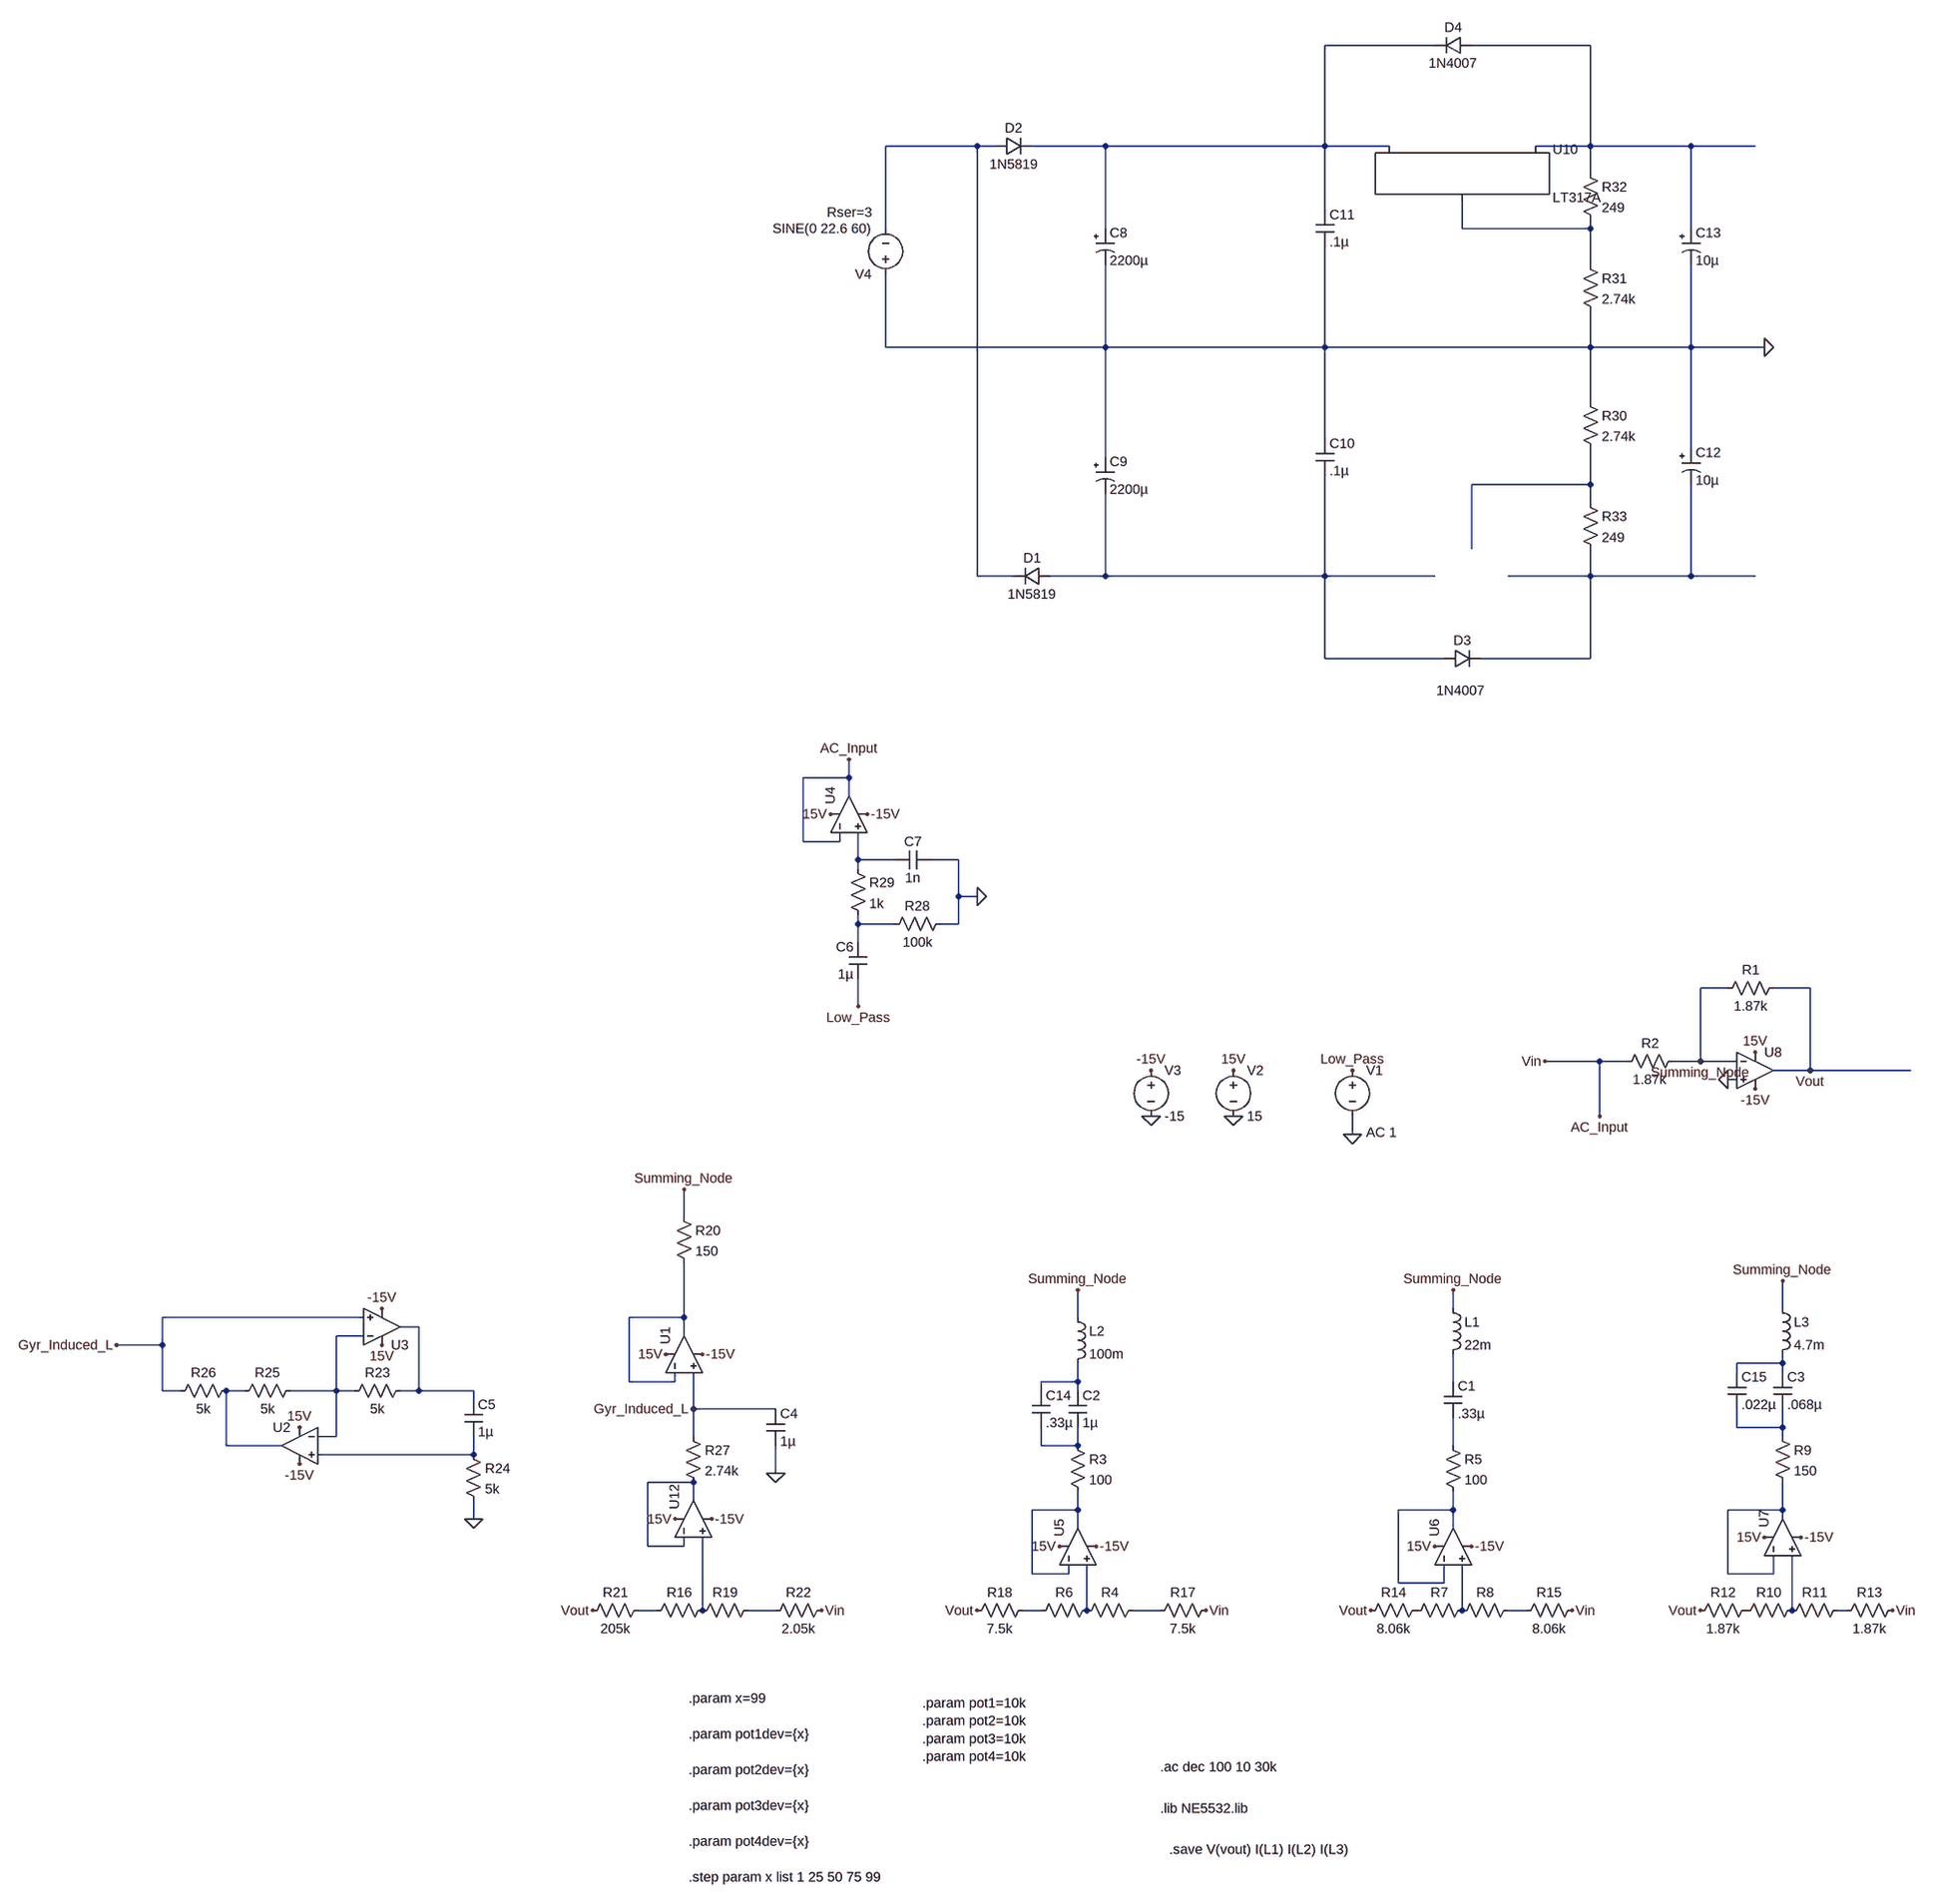
[diagram p0: schematic LCCircuit.asc]
LCCircuit.asc, the LTspice schematic file:
Version 4.1
SHEET 1 1272 1232
WIRE -1104 -2096 -1296 -2096
WIRE -832 -2096 -1040 -2096
WIRE -1904 -1920 -2064 -1920
WIRE -1872 -1920 -1904 -1920
WIRE -1680 -1920 -1808 -1920
WIRE -1296 -1920 -1296 -2096
WIRE -1296 -1920 -1680 -1920
WIRE -1184 -1920 -1296 -1920
WIRE -832 -1920 -832 -2096
WIRE -832 -1920 -928 -1920
WIRE -656 -1920 -832 -1920
WIRE -544 -1920 -656 -1920
WIRE -832 -1872 -832 -1920
WIRE -1296 -1808 -1296 -1920
WIRE -2064 -1776 -2064 -1920
WIRE -1680 -1776 -1680 -1920
WIRE -1056 -1776 -1056 -1824
WIRE -832 -1776 -832 -1792
WIRE -832 -1776 -1056 -1776
WIRE -656 -1776 -656 -1920
WIRE -832 -1712 -832 -1776
WIRE -2064 -1568 -2064 -1696
WIRE -1680 -1568 -1680 -1712
WIRE -1680 -1568 -2064 -1568
WIRE -1296 -1568 -1296 -1744
WIRE -1296 -1568 -1680 -1568
WIRE -832 -1568 -832 -1632
WIRE -832 -1568 -1296 -1568
WIRE -656 -1568 -656 -1712
WIRE -656 -1568 -832 -1568
WIRE -528 -1568 -656 -1568
WIRE -832 -1472 -832 -1568
WIRE -1296 -1408 -1296 -1568
WIRE -656 -1392 -656 -1568
WIRE -1680 -1376 -1680 -1568
WIRE -832 -1328 -832 -1392
WIRE -832 -1328 -1040 -1328
WIRE -832 -1296 -832 -1328
WIRE -1040 -1216 -1040 -1328
WIRE -1904 -1168 -1904 -1920
WIRE -1840 -1168 -1904 -1168
WIRE -1680 -1168 -1680 -1312
WIRE -1680 -1168 -1776 -1168
WIRE -1296 -1168 -1296 -1344
WIRE -1296 -1168 -1680 -1168
WIRE -1104 -1168 -1296 -1168
WIRE -832 -1168 -832 -1216
WIRE -832 -1168 -976 -1168
WIRE -656 -1168 -656 -1328
WIRE -656 -1168 -832 -1168
WIRE -544 -1168 -656 -1168
WIRE -1296 -1024 -1296 -1168
WIRE -1088 -1024 -1296 -1024
WIRE -832 -1024 -832 -1168
WIRE -832 -1024 -1024 -1024
WIRE -2128 -816 -2128 -848
WIRE -2128 -816 -2208 -816
WIRE -2128 -784 -2128 -816
WIRE -2208 -704 -2208 -816
WIRE -2144 -704 -2144 -720
WIRE -2144 -704 -2208 -704
WIRE -2112 -672 -2112 -720
WIRE -2048 -672 -2112 -672
WIRE -1936 -672 -1984 -672
WIRE -2112 -656 -2112 -672
WIRE -1936 -608 -1936 -672
WIRE -1904 -608 -1936 -608
WIRE -2112 -560 -2112 -576
WIRE -2048 -560 -2112 -560
WIRE -1936 -560 -1936 -608
WIRE -1936 -560 -1968 -560
WIRE -2112 -528 -2112 -560
WIRE -592 -448 -640 -448
WIRE -448 -448 -512 -448
WIRE -2112 -416 -2112 -464
WIRE -816 -320 -912 -320
WIRE -768 -320 -816 -320
WIRE -640 -320 -640 -448
WIRE -640 -320 -688 -320
WIRE -576 -320 -640 -320
WIRE -448 -304 -448 -448
WIRE -448 -304 -512 -304
WIRE -272 -304 -448 -304
WIRE -576 -288 -592 -288
WIRE -816 -224 -816 -320
WIRE -1248 -192 -1248 -224
WIRE -2416 -48 -2416 -96
WIRE -1072 112 -1072 80
WIRE -496 112 -496 64
WIRE -2976 128 -3328 128
WIRE -2416 128 -2416 32
WIRE -2416 128 -2512 128
WIRE -1728 128 -1728 80
WIRE -2880 144 -2912 144
WIRE -2976 160 -3024 160
WIRE -2416 160 -2416 128
WIRE -3328 176 -3328 128
WIRE -3328 176 -3408 176
WIRE -496 208 -496 192
WIRE -496 208 -576 208
WIRE -576 224 -576 208
WIRE -496 224 -496 208
WIRE -2512 240 -2512 128
WIRE -2432 240 -2432 224
WIRE -2432 240 -2512 240
WIRE -1728 240 -1728 208
WIRE -1728 240 -1792 240
WIRE -1072 240 -1072 192
WIRE -3328 256 -3328 176
WIRE -3296 256 -3328 256
WIRE -3184 256 -3216 256
WIRE -3024 256 -3024 160
WIRE -3024 256 -3104 256
WIRE -2992 256 -3024 256
WIRE -2880 256 -2880 144
WIRE -2880 256 -2912 256
WIRE -2784 256 -2880 256
WIRE -1792 256 -1792 240
WIRE -1728 256 -1728 240
WIRE -2784 272 -2784 256
WIRE -2400 288 -2400 224
WIRE -2256 288 -2400 288
WIRE -576 320 -576 288
WIRE -496 320 -496 288
WIRE -496 320 -576 320
WIRE -3024 336 -3024 256
WIRE -3024 336 -3056 336
WIRE -2400 336 -2400 288
WIRE -496 336 -496 320
WIRE -3216 352 -3216 256
WIRE -3120 352 -3216 352
WIRE -1792 352 -1792 320
WIRE -1728 352 -1728 320
WIRE -1728 352 -1792 352
WIRE -1072 352 -1072 304
WIRE -2784 368 -2784 336
WIRE -2784 368 -3056 368
WIRE -2256 400 -2256 352
WIRE -2400 416 -2480 416
WIRE -2400 448 -2400 416
WIRE -1728 464 -1728 432
WIRE -1728 464 -1808 464
WIRE -1072 464 -1072 432
WIRE -1072 464 -1168 464
WIRE -496 464 -496 416
WIRE -496 464 -592 464
WIRE -2784 480 -2784 448
WIRE -496 480 -496 464
WIRE -1728 496 -1728 464
WIRE -1072 496 -1072 464
WIRE -2480 528 -2480 416
WIRE -2416 528 -2416 512
WIRE -2416 528 -2480 528
WIRE -1808 576 -1808 464
WIRE -1744 576 -1744 560
WIRE -1744 576 -1808 576
WIRE -592 576 -592 464
WIRE -512 576 -512 544
WIRE -512 576 -592 576
WIRE -1168 592 -1168 464
WIRE -1088 592 -1088 560
WIRE -1088 592 -1168 592
WIRE -2464 640 -2496 640
WIRE -2384 640 -2384 512
WIRE -2256 640 -2304 640
WIRE -1792 640 -1824 640
WIRE -1712 640 -1712 560
WIRE -1584 640 -1632 640
WIRE -1056 640 -1056 560
WIRE -944 640 -976 640
WIRE -480 640 -480 544
WIRE -384 640 -400 640
FLAG -592 -288 0
FLAG -448 -304 Vout
FLAG -544 -336 15V
FLAG -544 -272 -15V
FLAG -1248 -192 0
FLAG -2128 -848 AC_Input
FLAG -816 -224 AC_Input
FLAG -1104 528 15V
FLAG -528 512 15V
FLAG -1760 528 15V
FLAG -1040 528 -15V
FLAG -1696 528 -15V
FLAG -464 512 -15V
FLAG -912 -320 Vin
FLAG -1504 640 Vin
FLAG -1904 640 Vout
FLAG -304 640 Vin
FLAG -864 640 Vin
FLAG -1216 640 Vout
FLAG -640 640 Vout
FLAG -2448 192 15V
FLAG -2384 192 -15V
FLAG -2176 640 Vin
FLAG -2576 640 Vout
FLAG -2416 -96 Summing_Node
FLAG -2784 480 0
FLAG -3408 176 Gyr_Induced_L
FLAG -3088 320 15V
FLAG -2944 176 15V
FLAG -2944 112 -15V
FLAG -3088 384 -15V
FLAG -1728 80 Summing_Node
FLAG -1072 80 Summing_Node
FLAG -496 64 Summing_Node
FLAG -640 -320 Summing_Node
FLAG -2432 480 15V
FLAG -2368 480 -15V
FLAG -2400 288 Gyr_Induced_L
FLAG -2256 400 0
FLAG -1904 -608 0
FLAG -2160 -752 15V
FLAG -2096 -752 -15V
FLAG -2112 -416 Low_Pass
FLAG -1248 -304 Low_Pass
FLAG -528 -1568 0
FLAG -1600 -304 -15V
FLAG -1456 -304 15V
FLAG -1600 -224 0
FLAG -1456 -224 0
SYMBOL voltage -1248 -320 R0
WINDOW 123 24 124 Left 2
WINDOW 39 0 0 Left 0
SYMATTR Value2 AC 1
SYMATTR InstName V1
SYMATTR Value ""
SYMBOL res -496 -464 R90
WINDOW 0 0 56 VBottom 2
WINDOW 3 32 56 VTop 2
SYMATTR InstName R1
SYMATTR Value 1.87k
SYMBOL ind -1744 112 R0
SYMATTR InstName L2
SYMATTR Value 100m
SYMATTR SpiceLine Rser=82
SYMBOL cap -1744 256 R0
SYMATTR InstName C2
SYMATTR Value 1µ
SYMBOL res -672 -336 R90
WINDOW 0 0 56 VBottom 2
WINDOW 3 32 56 VTop 2
SYMATTR InstName R2
SYMATTR Value 1.87k
SYMBOL res -1696 624 R90
WINDOW 0 0 56 VBottom 2
WINDOW 3 38 60 Invisible 0
SYMATTR InstName R6
SYMATTR Value {pot1*pot1dev/100}
SYMBOL res -1616 624 R90
WINDOW 0 0 56 VBottom 2
WINDOW 3 54 46 Invisible 0
SYMATTR InstName R4
SYMATTR Value {pot1-pot1*pot1dev/100}
SYMBOL res -1744 336 R0
SYMATTR InstName R3
SYMATTR Value 100
SYMBOL ind -1088 96 R0
SYMATTR InstName L1
SYMATTR Value 22m
SYMATTR SpiceLine Rser=80
SYMBOL cap -1088 240 R0
SYMATTR InstName C1
SYMATTR Value .33µ
SYMBOL res -1088 336 R0
SYMATTR InstName R5
SYMATTR Value 100
SYMBOL res -1040 624 R90
WINDOW 0 0 56 VBottom 2
WINDOW 3 32 56 Invisible 0
SYMATTR InstName R7
SYMATTR Value {pot2*pot2dev/100}
SYMBOL res -960 624 R90
WINDOW 0 0 56 VBottom 2
WINDOW 3 32 56 Invisible 0
SYMATTR InstName R8
SYMATTR Value {pot2-pot2*pot2dev/100}
SYMBOL ind -512 96 R0
SYMATTR InstName L3
SYMATTR Value 4.7m
SYMATTR SpiceLine Rser=13.6
SYMBOL cap -512 224 R0
SYMATTR InstName C3
SYMATTR Value .068µ
SYMBOL res -512 320 R0
SYMATTR InstName R9
SYMATTR Value 150
SYMBOL res -464 624 R90
WINDOW 0 0 56 VBottom 2
WINDOW 3 32 56 Invisible 0
SYMATTR InstName R10
SYMATTR Value {pot3*pot3dev/100}
SYMBOL res -384 624 R90
WINDOW 0 0 56 VBottom 2
WINDOW 3 32 56 Invisible 0
SYMATTR InstName R11
SYMATTR Value {pot3-pot3*pot3dev/100}
SYMBOL res -544 624 R90
WINDOW 0 0 56 VBottom 2
WINDOW 3 32 56 VTop 2
SYMATTR InstName R12
SYMATTR Value 1.87k
SYMBOL res -288 624 R90
WINDOW 0 0 56 VBottom 2
WINDOW 3 32 56 VTop 2
SYMATTR InstName R13
SYMATTR Value 1.87k
SYMBOL res -1232 656 R270
WINDOW 0 32 56 VTop 2
WINDOW 3 0 56 VBottom 2
SYMATTR InstName R14
SYMATTR Value 8.06k
SYMBOL res -848 624 R90
WINDOW 0 0 56 VBottom 2
WINDOW 3 32 56 VTop 2
SYMATTR InstName R15
SYMATTR Value 8.06k
SYMBOL res -1808 624 R90
WINDOW 0 0 56 VBottom 2
WINDOW 3 32 56 VTop 2
SYMATTR InstName R18
SYMATTR Value 7.5k
SYMBOL res -1488 624 R90
WINDOW 0 0 56 VBottom 2
WINDOW 3 32 56 VTop 2
SYMATTR InstName R17
SYMATTR Value 7.5k
SYMBOL cap -2272 288 R0
SYMATTR InstName C4
SYMATTR Value 1µ
SYMBOL res -2368 624 R90
WINDOW 0 0 56 VBottom 2
WINDOW 3 38 60 Invisible 0
SYMATTR InstName R16
SYMATTR Value {pot4*pot4dev/100}
SYMBOL res -2288 624 R90
WINDOW 0 0 56 VBottom 2
WINDOW 3 54 46 Invisible 0
SYMATTR InstName R19
SYMATTR Value {pot4-pot4*pot4dev/100}
SYMBOL res -2432 -64 R0
SYMATTR InstName R20
SYMATTR Value 150
SYMBOL res -2480 624 R90
WINDOW 0 0 56 VBottom 2
WINDOW 3 32 56 VTop 2
SYMATTR InstName R21
SYMATTR Value 205k
SYMBOL res -2160 624 R90
WINDOW 0 0 56 VBottom 2
WINDOW 3 32 56 VTop 2
SYMATTR InstName R22
SYMATTR Value 2.05k
SYMBOL res -2896 240 R90
WINDOW 0 0 56 VBottom 2
WINDOW 3 32 56 VTop 2
SYMATTR InstName R23
SYMATTR Value 5k
SYMBOL cap -2800 272 R0
SYMATTR InstName C5
SYMATTR Value 1µ
SYMBOL res -2800 352 R0
SYMATTR InstName R24
SYMATTR Value 5k
SYMBOL res -3088 240 R90
WINDOW 0 0 56 VBottom 2
WINDOW 3 32 56 VTop 2
SYMATTR InstName R25
SYMATTR Value 5k
SYMBOL res -3200 240 R90
WINDOW 0 0 56 VBottom 2
WINDOW 3 32 56 VTop 2
SYMATTR InstName R26
SYMATTR Value 5k
SYMBOL res -2416 320 R0
SYMATTR InstName R27
SYMATTR Value 2.74k
SYMBOL cap -2096 -464 R180
WINDOW 0 24 56 Left 2
WINDOW 3 24 8 Left 2
SYMATTR InstName C6
SYMATTR Value 1µ
SYMBOL res -1952 -576 R90
WINDOW 0 0 56 VBottom 2
WINDOW 3 32 56 VTop 2
SYMATTR InstName R28
SYMATTR Value 100k
SYMBOL cap -1984 -688 R90
WINDOW 0 0 32 VBottom 2
WINDOW 3 32 32 VTop 2
SYMATTR InstName C7
SYMATTR Value 1n
SYMBOL res -2128 -672 R0
SYMATTR InstName R29
SYMATTR Value 1k
SYMBOL voltage -2064 -1680 R180
WINDOW 123 0 0 Left 0
WINDOW 39 24 124 Left 2
SYMATTR SpiceLine Rser=3
SYMATTR InstName V4
SYMATTR Value SINE(0 22.6 60)
SYMBOL diode -1776 -1184 R90
WINDOW 0 0 32 VBottom 2
WINDOW 3 32 32 VTop 2
SYMATTR InstName D1
SYMATTR Value 1N5819
SYMBOL diode -1872 -1904 R270
WINDOW 0 32 32 VTop 2
WINDOW 3 0 32 VBottom 2
SYMATTR InstName D2
SYMATTR Value 1N5819
SYMBOL polcap -1696 -1776 R0
SYMATTR InstName C8
SYMATTR Value 2200µ
SYMBOL polcap -1696 -1376 R0
SYMATTR InstName C9
SYMATTR Value 2200µ
SYMBOL PowerProducts\\LT317A -1056 -1920 R0
SYMATTR InstName U10
SYMBOL diode -1088 -1008 R270
WINDOW 0 32 32 VTop 2
WINDOW 3 -24 29 VBottom 2
SYMATTR InstName D3
SYMATTR Value 1N4007
SYMBOL diode -1040 -2112 R90
WINDOW 0 0 32 VBottom 2
WINDOW 3 32 32 VTop 2
SYMATTR InstName D4
SYMATTR Value 1N4007
SYMBOL cap -1312 -1408 R0
SYMATTR InstName C10
SYMATTR Value .1µ
SYMBOL cap -1312 -1808 R0
SYMATTR InstName C11
SYMATTR Value .1µ
SYMBOL res -848 -1888 R0
SYMATTR InstName R32
SYMATTR Value 249
SYMBOL res -848 -1312 R0
SYMATTR InstName R33
SYMATTR Value 249
SYMBOL polcap -672 -1392 R0
SYMATTR InstName C12
SYMATTR Value 10µ
SYMBOL polcap -672 -1776 R0
SYMATTR InstName C13
SYMATTR Value 10µ
SYMBOL voltage -1456 -320 R0
WINDOW 123 0 0 Left 0
WINDOW 39 0 0 Left 0
SYMATTR InstName V2
SYMATTR Value 15
SYMBOL voltage -1600 -320 R0
WINDOW 123 0 0 Left 0
WINDOW 39 0 0 Left 0
SYMATTR InstName V3
SYMATTR Value -15
SYMBOL cap -1808 256 R0
SYMATTR InstName C14
SYMATTR Value .33µ
SYMBOL cap -592 224 R0
SYMATTR InstName C15
SYMATTR Value .022µ
SYMBOL OpAmps\\UniversalOpAmp2 -2400 480 R270
SYMATTR InstName U12
SYMBOL OpAmps\\UniversalOpAmp2 -2416 192 R270
SYMATTR InstName U1
SYMBOL OpAmps\\UniversalOpAmp2 -3088 352 M0
SYMATTR InstName U2
SYMBOL OpAmps\\UniversalOpAmp2 -2944 144 M180
SYMATTR InstName U3
SYMBOL OpAmps\\UniversalOpAmp2 -2128 -752 R270
SYMATTR InstName U4
SYMBOL OpAmps\\UniversalOpAmp2 -1728 528 R270
SYMATTR InstName U5
SYMBOL OpAmps\\UniversalOpAmp2 -1072 528 R270
SYMATTR InstName U6
SYMBOL OpAmps\\UniversalOpAmp2 -496 512 R270
SYMATTR InstName U7
SYMBOL OpAmps\\UniversalOpAmp2 -544 -304 R0
SYMATTR InstName U8
SYMBOL res -848 -1488 R0
SYMATTR InstName R30
SYMATTR Value 2.74k
SYMBOL res -848 -1728 R0
SYMATTR InstName R31
SYMATTR Value 2.74k
TEXT -1584 992 Left 2 !.ac dec 100 10 30k
TEXT -2000 880 Left 2 !.param pot1=10k\n.param pot2=10k\n.param pot3=10k\n.param pot4=10k
TEXT -1584 1064 Left 2 !.lib NE5532.lib
TEXT -1568 1136 Left 2 !.save V(vout) I(L1) I(L2) I(L3)
TEXT -2408 872 Left 2 !.param x=99\n\n.param pot1dev={x}\n\n.param pot2dev={x}\n\n.param pot3dev={x}\n\n.param pot4dev={x}\n\n.step param x list 1 25 50 75 99

The netlist it stands for:
* LCCircuit.asc
V1 Low_Pass 0 AC 1
R1 Vout Summing_Node 1.87k
L2 Summing_Node N014 100m Rser=82
C2 N014 N018 1µ
R2 Summing_Node Vin 1.87k
R6 N029 N028 {pot1*pot1dev/100}
R4 N030 N029 {pot1-pot1*pot1dev/100}
R3 N018 N022 100
L1 Summing_Node N015 22m Rser=80
C1 N015 N019 .33µ
R5 N019 N023 100
R7 N031 P001 {pot2*pot2dev/100}
R8 N032 N031 {pot2-pot2*pot2dev/100}
L3 Summing_Node N013 4.7m Rser=13.6
C3 N013 N017 .068µ
R9 N017 N024 150
R10 N033 P002 {pot3*pot3dev/100}
R11 N034 N033 {pot3-pot3*pot3dev/100}
R12 P002 Vout 1.87k
R13 Vin N034 1.87k
R14 Vout P001 8.06k
R15 Vin N032 8.06k
R18 N028 Vout 7.5k
R17 Vin N030 7.5k
C4 Gyr_Induced_L 0 1µ
R16 N026 N025 {pot4*pot4dev/100}
R19 N027 N026 {pot4-pot4*pot4dev/100}
R20 Summing_Node N010 150
R21 N025 Vout 205k
R22 Vin N027 2.05k
R23 N011 N012 5k
C5 N011 N020 1µ
R24 N020 0 5k
R25 N012 N016 5k
R26 N016 Gyr_Induced_L 5k
R27 Gyr_Induced_L N021 2.74k
C6 Low_Pass N009 1µ
R28 0 N009 100k
C7 0 N008 1n
R29 N008 N009 1k
V4 0 N003 SINE(0 22.6 60) Rser=3
D1 N006 N003 1N5819
D2 N003 N001 1N5819
C8 N001 0 2200µ
C9 0 N006 2200µ
X§U10 N004 N002 N001 LT317A
D3 N006 N007 1N4007
D4 N002 N001 1N4007
C10 0 N006 .1µ
C11 N001 0 .1µ
R32 N002 N004 249
R33 N005 N007 249
C12 0 N007 10µ
C13 N002 0 10µ
V2 15V 0 15
V3 -15V 0 -15
C14 N014 N018 .33µ
C15 N013 N017 .022µ
X§U12 N026 N021 15V -15V N021 level2 Avol=1Meg GBW=10Meg Slew=10Meg Ilimit=25m Rail=0 Vos=0 En=0 Enk=0 In=0 Ink=0 Rin=500Meg  ; pins In+ In- V+ V- OUT
X§U1 Gyr_Induced_L N010 15V -15V N010 level2 Avol=1Meg GBW=10Meg Slew=10Meg Ilimit=25m Rail=0 Vos=0 En=0 Enk=0 In=0 Ink=0 Rin=500Meg  ; pins In+ In- V+ V- OUT
X§U2 N020 N012 15V -15V N016 level2 Avol=1Meg GBW=10Meg Slew=10Meg Ilimit=25m Rail=0 Vos=0 En=0 Enk=0 In=0 Ink=0 Rin=500Meg  ; pins In+ In- V+ V- OUT
X§U3 Gyr_Induced_L N012 15V -15V N011 level2 Avol=1Meg GBW=10Meg Slew=10Meg Ilimit=25m Rail=0 Vos=0 En=0 Enk=0 In=0 Ink=0 Rin=500Meg  ; pins In+ In- V+ V- OUT
X§U4 N008 Vin 15V -15V Vin level2 Avol=1Meg GBW=10Meg Slew=10Meg Ilimit=25m Rail=0 Vos=0 En=0 Enk=0 In=0 Ink=0 Rin=500Meg  ; pins In+ In- V+ V- OUT
X§U5 N029 N022 15V -15V N022 level2 Avol=1Meg GBW=10Meg Slew=10Meg Ilimit=25m Rail=0 Vos=0 En=0 Enk=0 In=0 Ink=0 Rin=500Meg  ; pins In+ In- V+ V- OUT
X§U6 N031 N023 15V -15V N023 level2 Avol=1Meg GBW=10Meg Slew=10Meg Ilimit=25m Rail=0 Vos=0 En=0 Enk=0 In=0 Ink=0 Rin=500Meg  ; pins In+ In- V+ V- OUT
X§U7 N033 N024 15V -15V N024 level2 Avol=1Meg GBW=10Meg Slew=10Meg Ilimit=25m Rail=0 Vos=0 En=0 Enk=0 In=0 Ink=0 Rin=500Meg  ; pins In+ In- V+ V- OUT
X§U8 0 Summing_Node 15V -15V Vout level2 Avol=1Meg GBW=10Meg Slew=10Meg Ilimit=25m Rail=0 Vos=0 En=0 Enk=0 In=0 Ink=0 Rin=500Meg  ; pins In+ In- V+ V- OUT
R30 0 N005 2.74k
R31 N004 0 2.74k
.model D D
.lib standard.dio
.ac dec 100 10 30k
.param pot1=10k
.param pot2=10k
.param pot3=10k
.param pot4=10k
.lib NE5532.lib
.save V(vout) I(L1) I(L2) I(L3)
.param x=99
.param pot1dev={x}
.param pot2dev={x}
.param pot3dev={x}
.param pot4dev={x}
.step param x list 1 25 50 75 99
.lib LTC.lib
.lib UniversalOpAmp2.lib
.backanno
.end